# Altium schematic sheet IPM-DRIVER-1.SchDoc
size A4
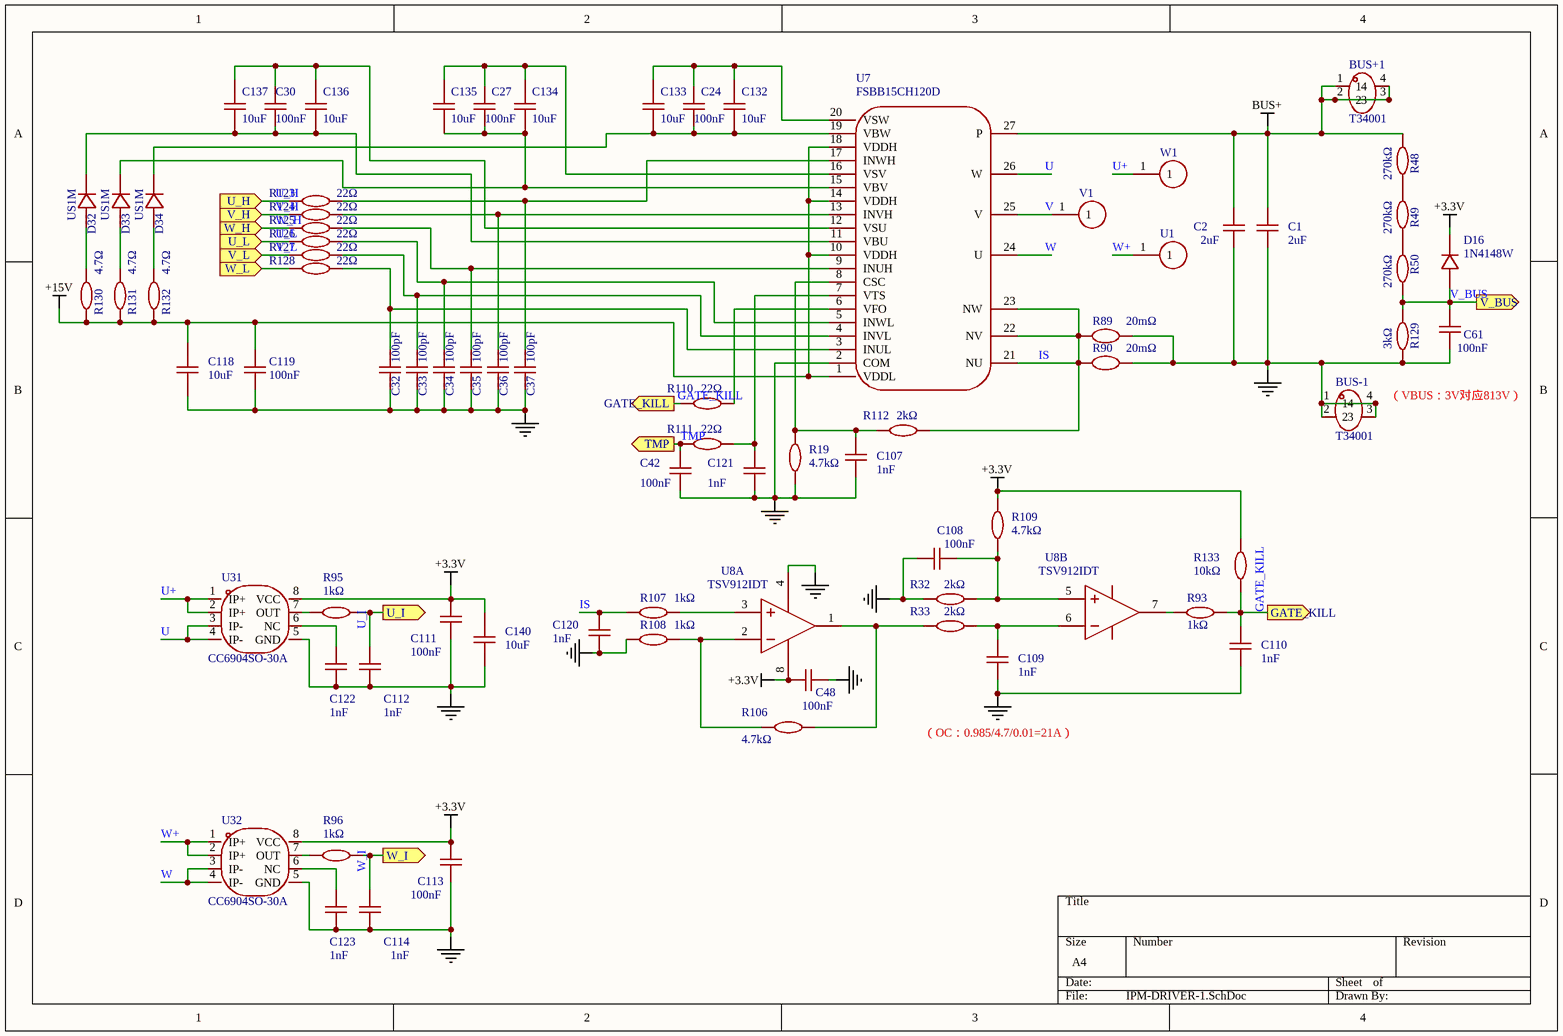
[diagram p0: IPM-DRIVER-1.SchDoc]

## Parts
BUS+1  T34001  [CONN-TH_T34001]
BUS-1  T34001  [CONN-TH_T34001]
C1  2uF  [CAP-TH_L32.0-W13.0-P27.50-D0.8]
C2  2uF  [CAP-TH_L32.0-W13.0-P27.50-D0.8]
C24  100nF  [C0603]
C27  100nF  [C0603]
C30  100nF  [C0603]
C32  100pF  [C0603]
C33  100pF  [C0603]
C34  100pF  [C0603]
C35  100pF  [C0603]
C36  100pF  [C0603]
C37  100pF  [C0603]
C42  100nF  [C0603]
C48  100nF  [C0603]
C61  100nF  [C0603]
C107  1nF  [C0603]
C108  100nF  [C0603]
C109  1nF  [C0603]
C110  1nF  [C0603]
C111  100nF  [C0603]
C112  1nF  [C0603]
C113  100nF  [C0603]
C114  1nF  [C0603]
C118  10uF  [C1206]
C119  100nF  [C0603]
C120  1nF  [C0603]
C121  1nF  [C0603]
C122  1nF  [C0603]
C123  1nF  [C0603]
C132  10uF  [C1206]
C133  10uF  [C1206]
C134  10uF  [C1206]
C135  10uF  [C1206]
C136  10uF  [C1206]
C137  10uF  [C1206]
C140  10uF  [C0805]
D16  1N4148W  [SOD-123_L2.8-W1.8-LS3.7-RD]
D32  US1M  [SMA_L4.4-W2.8-LS5.4-RD]
D33  US1M  [SMA_L4.4-W2.8-LS5.4-RD]
D34  US1M  [SMA_L4.4-W2.8-LS5.4-RD]
R19  4.7kΩ  [R0603]
R32  2kΩ  [R0603]
R33  2kΩ  [R0603]
R48  270kΩ  [R1206]
R49  270kΩ  [R1206]
R50  270kΩ  [R1206]
R89  20mΩ  [RES-SMD_L6.4-W3.2-1]
R90  20mΩ  [RES-SMD_L6.4-W3.2-1]
R93  1kΩ  [R0603]
R95  1kΩ  [R0603]
R96  1kΩ  [R0603]
R106  4.7kΩ  [R0603]
R107  1kΩ  [R0603]
R108  1kΩ  [R0603]
R109  4.7kΩ  [R0603]
R110  22Ω  [R0603]
R111  22Ω  [R0603]
R112  2kΩ  [R0603]
R123  22Ω  [R0603]
R124  22Ω  [R0603]
R125  22Ω  [R0603]
R126  22Ω  [R0603]
R127  22Ω  [R0603]
R128  22Ω  [R0603]
R129  3kΩ  [R1206]
R130  4.7Ω  [R0805]
R131  4.7Ω  [R0805]
R132  4.7Ω  [R0805]
R133  10kΩ  [R0603]
U1  (no value)  [HOLE-1.6]
U7  FSBB15CH120D  [SPM-27-RA]
U8  TSV912IDT  [SO-8_L4.9-W3.9-P1.27-LS6.0-BL]  (parts A,B of 2)
U31  CC6904SO-30A  [SOP-8_L4.9-W3.9-P1.27-LS6.0-BL]
U32  CC6904SO-30A  [SOP-8_L4.9-W3.9-P1.27-LS6.0-BL]
V1  (no value)  [HOLE-1.6]
W1  (no value)  [HOLE-1.6]

## Ports
GATE_KILL (out), TMP (out), U_H (in), U_I (out), U_L (in), V_BUS (out), V_H (in), V_L (in), W_H (in), W_I (out), W_L (in)

## Nets
+3.3V: C48.1 C111.1 C113.1 C140.2 D16.1(K) R109.2 R133.2 U8.8(VCC+) U31.8(VCC) U32.8(VCC)
+15V: C118.2 C119.1 R130.1 R131.1 R132.1 U7.1(VDDL) U7.10(VDDH) U7.14(VDDH) U7.18(VDDH)
BUS+: BUS+1.1 BUS+1.2 BUS+1.3 BUS+1.4 C1.2 C2.2 R48.2 U7.27(P)
GND: BUS-1.1 BUS-1.2 BUS-1.3 BUS-1.4 C1.1 C2.1 C32.1 C33.1 C34.1 C35.1 C36.1 C37.1 C42.2 C48.2 C61.2 C107.1 C108.1 C109.1 C110.1 C111.2 C112.1 C113.2 C114.1 C118.1 C119.2 C120.2 C121.1 C122.1 C123.1 C140.1 R19.1 R32.1 R89.2 R90.2 R108.2 R129.1 U7.2(COM) U8.4(VCC-) U31.5(GND) U32.5(GND)
GATE_KILL: C110.2 R93.1 R110.1 R133.1 ; port GATE_KILL
IS: C120.1 R89.1 R90.1 R107.2 R112.2 U7.21(NU) U7.22(NV) U7.23(NW)
TMP: C42.1 R111.1 ; port TMP
U: U7.26(W) U31.3(IP-) U31.4(IP-)
U+: U31.1(IP+) U31.2(IP+) W1.1
U_H: R123.1 ; port U_H
U_I: C112.2 R95.1 ; port U_I
U_L: R126.1 ; port U_L
V: U7.25(V) V1.1
V_BUS: C61.1 D16.2(A) R50.1 R129.2 ; port V_BUS
V_H: R124.1 ; port V_H
V_L: R127.1 ; port V_L
W: U7.24(U) U32.3(IP-) U32.4(IP-)
W+: U1.1 U32.1(IP+) U32.2(IP+)
W_H: R125.1 ; port W_H
W_I: C114.2 R96.1 ; port W_I
W_L: R128.1 ; port W_L
NetC24_1: C24.1 C132.2 C133.2 U7.20(VSW)
NetC24_2: C24.2 C132.1 C133.1 D34.1(C) U7.19(VBW)
NetC27_1: C27.1 C134.2 C135.2 U7.16(VSV)
NetC27_2: C27.2 C134.1 C135.1 D33.1(C) U7.15(VBV)
NetC30_1: C30.1 C136.2 C137.2 U7.12(VSU)
NetC30_2: C30.2 C136.1 C137.1 D32.1(C) U7.11(VBU)
NetC32_2: C32.2 R128.2 U7.3(INUL)
NetC33_2: C33.2 R127.2 U7.4(INVL)
NetC34_2: C34.2 R126.2 U7.5(INWL)
NetC35_2: C35.2 R125.2 U7.9(INUH)
NetC36_2: C36.2 R124.2 U7.13(INVH)
NetC37_2: C37.2 R123.2 U7.17(INWH)
NetC107_2: C107.2 R19.2 R112.1 U7.8(CSC)
NetC108_2: C108.2 R32.2 R109.1 U8.5(IN2+)
NetC109_2: C109.2 R33.2 U8.6(IN2-)
NetC121_2: C121.2 R111.2 U7.7(VTS)
NetC122_2: C122.2 U31.6(NC)
NetC123_2: C123.2 U32.6(NC)
NetD32_2: D32.2(A) R130.2
NetD33_2: D33.2(A) R131.2
NetD34_2: D34.2(A) R132.2
NetR33_1: R33.1 R106.2 U8.1(OUT1)
NetR48_1: R48.1 R49.2
NetR49_1: R49.1 R50.2
NetR93_2: R93.2 U8.7(OUT2)
NetR95_2: R95.2 U31.7(OUT)
NetR96_2: R96.2 U32.7(OUT)
NetR106_1: R106.1 R108.1 U8.2(IN1-)
NetR107_1: R107.1 U8.3(IN1+)
NetR110_2: R110.2 U7.6(VFO)

## Notes on the sheet
- （VBUS：3V对应813V）
- （OC：0.985/4.7/0.01=21A）

## Library data of the parts
BUS+1 BUS-1 = T34001: Manufacturer: XFCN(兴飞); Add into BOM: yes; Symbol: T34001; Device: T34001; Supplier: LCSC; Supplier Part: C481448; Manufacturer Part: T34001; JLCPCB Part Class: 扩展库; LCSC Part Name: 四脚 M3 二件套; Supplier Footprint: 插件; Datasheet: https://atta.szlcsc.com/upload/public/pdf/source/20200107/C481448_4214B4EB74A46B70BD82BA8A456D4EDD.pdf; Convert to PCB: yes; Comment_1: T34001
C1 C2 = C3D3A205KB00C00: 容值:2uF;精度:±10%;额定电压:1kV;工作温度:-40℃~+105℃;; Manufacturer: faratronic(厦门法拉); Manufacturer Part: C3D1M205KB00C00; Add into BOM: yes; Tolerance: ±10%; Voltage Rated: 1kV; Symbol: C3D3A205KB00C00; Device: C3D3A205KB00C00; Supplier: LCSC; Supplier Part: C2979669; Value: 2uF; JLCPCB Part Class: 扩展库; LCSC Part Name: 2uF ±10% 1kV; Supplier Footprint: 插件,P=27.5mm; Datasheet: https://atta.szlcsc.com/upload/public/pdf/source/20220311/E68D7E85A489AC17A4FEDF411604B395.pdf; Convert to PCB: yes; Operating Temperature: -40℃~+105℃; Comment_1: 2uF
C24 C27 C30 C42 C48 C61 C108 C111 C113 C119 = 0603B104K500NT: 容值:100nF;精度:±10%;额定电压:50V;材质(温度系数):X7R;; Manufacturer: FH(风华); Add into BOM: yes; Tolerance: ±10%; Voltage Rated: 50V; Temperature Coefficient: X7R; Symbol: 0603B104K500NT; Device: 0603B104K500NT; Supplier: LCSC; Manufacturer Part: 0603B104K500NT; Value: 100nF; Supplier Part: C30926; JLCPCB Part Class: 扩展库; LCSC Part Name: 100nF ±10% 50V; Supplier Footprint: 0603; Datasheet: https://atta.szlcsc.com/upload/public/pdf/source/20200305/C486355_26A10D38EF8C2A5C37091D0039909270.pdf; Convert to PCB: yes; Comment_1: 100nF
C32-C37 = CC0603KRX7R9BB101: 容值:100pF;精度:±10%;额定电压:50V;材质(温度系数):X7R;; Manufacturer: YAGEO(国巨); Add into BOM: yes; Tolerance: ±10%; Voltage Rated: 50V; Temperature Coefficient: X7R; Symbol: CC0603KRX7R9BB101; Device: CC0603KRX7R9BB101; Supplier: LCSC; Supplier Part: C160903; Manufacturer Part: CC0603KRX7R9BB101; Value: 100pF; JLCPCB Part Class: 扩展库; LCSC Part Name: 100pF ±10% 50V; Supplier Footprint: 0603; Datasheet: https://atta.szlcsc.com/upload/public/pdf/source/20180910/C282072_33301C7F631E79921B82A8DAC6BCC5B3.pdf; Convert to PCB: yes; Comment_1: 100pF
C107 C109 C110 C112 C114 C120-C123 = CC0603KRX7R9BB102: 容值:1nF;精度:±10%;额定电压:50V;材质(温度系数):X7R;; Manufacturer: YAGEO(国巨); Add into BOM: yes; Tolerance: ±10%; Voltage Rated: 50V; Temperature Coefficient: X7R; Symbol: CC0603KRX7R9BB102; Device: CC0603KRX7R9BB102; Supplier: LCSC; Manufacturer Part: CC0603KRX7R9BB102; Value: 1nF; Supplier Part: C100040; JLCPCB Part Class: 扩展库; LCSC Part Name: 1nF ±10% 50V; Supplier Footprint: 0603; Datasheet: https://atta.szlcsc.com/upload/public/pdf/source/20180910/C282072_33301C7F631E79921B82A8DAC6BCC5B3.pdf; Convert to PCB: yes; Comment_1: 1nF
C118 = 1206B106K500NT: 容值:10uF;精度:±10%;额定电压:50V;材质(温度系数):X7R;; Manufacturer: FH(风华); Add into BOM: yes; Tolerance: ±10%; Voltage Rated: 50V; Temperature Coefficient: X7R; Symbol: 1206B106K500NT; Device: 1206B106K500NT; Supplier: LCSC; Supplier Part: C303950; Manufacturer Part: 1206B106K500NT; Value: 10uF; JLCPCB Part Class: 扩展库; LCSC Part Name: 10uF ±10% 50V; Supplier Footprint: 1206; Datasheet: https://atta.szlcsc.com/upload/public/pdf/source/20200305/C486355_26A10D38EF8C2A5C37091D0039909270.pdf; Convert to PCB: yes; Comment_1: 10uF
C132-C137 = 1206B106K250NT: 容值:10uF;精度:±10%;额定电压:25V;材质(温度系数):X7R;; Manufacturer: FH(风华); Add into BOM: yes; Tolerance: ±10%; Voltage Rated: 25V; Temperature Coefficient: X7R; Symbol: 1206B106K250NT; Device: 1206B106K250NT; Supplier: LCSC; Manufacturer Part: 1206B106K250NT; Value: 10uF; Supplier Part: C90538; JLCPCB Part Class: 扩展库; LCSC Part Name: 10uF ±10% 25V; Supplier Footprint: 1206; Datasheet: https://atta.szlcsc.com/upload/public/pdf/source/20200305/C486355_26A10D38EF8C2A5C37091D0039909270.pdf; Convert to PCB: yes; Comment_1: 10uF
C140 = CL21B106KOQNNNE: 容值:10uF;精度:±10%;额定电压:16V;材质(温度系数):X7R;; Manufacturer: SAMSUNG(三星); Add into BOM: yes; Tolerance: ±10%; Voltage Rated: 16V; Temperature Coefficient: X7R; Symbol: CL21B106KOQNNNE; Device: CL21B106KOQNNNE; Supplier: LCSC; Manufacturer Part: CL21B106KOQNNNE; Value: 10uF; Supplier Part: C95841; JLCPCB Part Class: 扩展库; LCSC Part Name: 10uF ±10% 16V; Supplier Footprint: 0805; Datasheet: https://atta.szlcsc.com/upload/public/pdf/source/20160218/1457707763339.pdf; Convert to PCB: yes; Comment_1: 10uF
D16 = 1N4148W_C2099: 二极管配置:独立式;正向压降(Vf):1.25V@150mA;直流反向耐压(Vr):100V;平均整流电流(Io):150mA;功率:500mW;反向恢复时间(trr):4ns;; Manufacturer: CJ(江苏长电/长晶); Symbol: 1N4148W T4; Add into BOM: yes; Diode Configuration: 独立式; Reverse Voltage (Vr): 100V; Average Rectified Current (Io): 150mA; Power Dissipation: 500mW; Reverse Leakage Current: 1uA@75V; Reverse Recovery Time (trr): 4ns; Device: 1N4148W_C2099; Supplier: LCSC; Manufacturer Part: 1N4148W; Supplier Part: C2099; JLCPCB Part Class: 扩展库; LCSC Part Name: 电压:100V 电流:150mA; Supplier Footprint: SOD-123; Datasheet: https://atta.szlcsc.com/upload/public/pdf/source/20120428/1457706480199.pdf; Convert to PCB: yes; Forward Voltage (Vf@If): 1.25V@150mA; Operating Temperature: -; Comment_1: 1N4148W
D32-D34 = US1M_C412437: 二极管配置:独立式;正向压降(Vf):1.7V@1A;直流反向耐压(Vr):1kV;平均整流电流(Io):1A;反向恢复时间(trr):75ns;; Manufacturer: MDD; Symbol: US1MG_C412437; Add into BOM: yes; Diode Configuration: 独立式; Reverse Voltage (Vr): 1kV; Average Rectified Current (Io): 1A; Reverse Leakage Current: 5uA@1kV; Reverse Recovery Time (trr): 75ns; Device: US1M_C412437; Supplier: LCSC; Supplier Part: C412437; Manufacturer Part: US1M; JLCPCB Part Class: 基础库; LCSC Part Name: 电压:1kV 电流:1A; Supplier Footprint: SMA; Datasheet: https://atta.szlcsc.com/upload/public/pdf/source/20230314/F0756B025DF5B8F55B4CA0C779F501E8.pdf; Convert to PCB: yes; Forward Voltage (Vf@If): 1.7V@1A; Operating Temperature: -50℃~+150℃@(Tj); Comment_1: US1M
R19 R106 R109 = 0603WAF4701T5E: 电阻类型:厚膜电阻;阻值:4.7kΩ;精度:±1%;功率:100mW;最大工作电压:75V;温度系数:±100ppm/℃;; Manufacturer: UNI-ROYAL(厚声); Add into BOM: yes; Tolerance: ±1%; Power(Watts): 100mW; Overload Voltage (Max): 75V; Symbol: 0603WAF4701T5E; Device: 0603WAF4701T5E; Supplier: LCSC; Manufacturer Part: 0603WAF4701T5E; Supplier Part: C23162; Value: 4.7kΩ; JLCPCB Part Class: 基础库; LCSC Part Name: 4.7kΩ ±1% 100mW 厚膜电阻; Supplier Footprint: 0603; Datasheet: https://atta.szlcsc.com/upload/public/pdf/source/20200306/C422600_1E6D84923E4A46A82E41ADD87F860B5C.pdf; Convert to PCB: yes; Type: 厚膜电阻; Temperature Coefficient: ±100ppm/℃; Operating Temperature Range: -55℃~+155℃; Comment_1: 4.7kΩ
R32 R33 R112 = 0603WAF2001T5E: 电阻类型:厚膜电阻;阻值:2kΩ;精度:±1%;功率:100mW;最大工作电压:75V;温度系数:±100ppm/℃;; Manufacturer: UNI-ROYAL(厚声); Add into BOM: yes; Tolerance: ±1%; Power(Watts): 100mW; Overload Voltage (Max): 75V; Symbol: 0603WAF2001T5E; Device: 0603WAF2001T5E; Supplier: LCSC; Manufacturer Part: 0603WAF2001T5E; Supplier Part: C22975; Value: 2kΩ; JLCPCB Part Class: 基础库; LCSC Part Name: 2kΩ ±1% 100mW 厚膜电阻; Supplier Footprint: 0603; Datasheet: https://atta.szlcsc.com/upload/public/pdf/source/20200306/C422600_1E6D84923E4A46A82E41ADD87F860B5C.pdf; Convert to PCB: yes; Type: 厚膜电阻; Temperature Coefficient: ±100ppm/℃; Operating Temperature Range: -55℃~+155℃; Comment_1: 2kΩ
R48-R50 = RC1206FR-07270KL: 电阻类型:厚膜电阻;阻值:270kΩ;精度:±1%;功率:250mW;最大工作电压:200V;温度系数:±100ppm/℃;; Manufacturer: YAGEO(国巨); Add into BOM: yes; Tolerance: ±1%; Power(Watts): 250mW; Overload Voltage (Max): 200V; Symbol: RC1206FR-07270KL; Device: RC1206FR-07270KL; LCSC Part Name: 厚膜电阻 270kΩ ±1% 250mW; Supplier Part: C137342; Manufacturer Part: RC1206FR-07270KL; Supplier Footprint: 1206; JLCPCB Part Class: 扩展库; Datasheet: https://atta.szlcsc.com/upload/public/pdf/source/20180821/C275644_0D56F95EFF785E7D9A1FEF436B37DA78.pdf; Supplier: LCSC; Convert to PCB: yes; Type: 厚膜电阻; Value: 270kΩ; Temperature Coefficient: ±100ppm/℃; Operating Temperature Range: -55℃~+155℃; Comment_1: 270kΩ
R89 R90 = LR2512D-3W-20mR-1%: 电阻类型:采样电阻;阻值:20mΩ;精度:±1%;功率:3W;温度系数:25ppm/℃~+50ppm/℃;安装方式:贴片;; Manufacturer: Milliohm(毫欧); Add into BOM: yes; Tolerance: ±1%; Power(Watts): 3W; Mounting Sytle: 贴片; Symbol: LR2512D-3W-20MR-1%; Device: LR2512D-3W-20mR-1%; Supplier: LCSC; Supplier Part: C500741; Manufacturer Part: LR2512D-3W-20mR-1%; Value: 20mΩ; JLCPCB Part Class: 扩展库; LCSC Part Name: 20mΩ ±1% 3W; Supplier Footprint: 2512; Datasheet: https://atta.szlcsc.com/upload/public/pdf/source/20211008/27BCB003066C6550DC06C87D8395239C.pdf; Convert to PCB: yes; Type: 采样电阻; Temperature Coefficient: 25ppm/℃~+50ppm/℃; Comment_1: 20mΩ
R93 R95 R96 R107 R108 = 0603WAF1001T5E: 电阻类型:厚膜电阻;阻值:1kΩ;精度:±1%;功率:100mW;最大工作电压:75V;温度系数:±100ppm/℃;; Manufacturer: UNI-ROYAL(厚声); Add into BOM: yes; Tolerance: ±1%; Power(Watts): 100mW; Overload Voltage (Max): 75V; Symbol: 0603WAF1001T5E; Device: 0603WAF1001T5E; Supplier: LCSC; Manufacturer Part: 0603WAF1001T5E; Supplier Part: C21190; Value: 1kΩ; JLCPCB Part Class: 基础库; LCSC Part Name: 1kΩ ±1% 100mW 厚膜电阻; Supplier Footprint: 0603; Datasheet: https://atta.szlcsc.com/upload/public/pdf/source/20200306/C422600_1E6D84923E4A46A82E41ADD87F860B5C.pdf; Convert to PCB: yes; Type: 厚膜电阻; Temperature Coefficient: ±100ppm/℃; Operating Temperature Range: -55℃~+155℃; Comment_1: 1kΩ
R110 R111 R123-R128 = 0603WAF220JT5E: 电阻类型:厚膜电阻;阻值:22Ω;精度:±1%;功率:100mW;最大工作电压:75V;温度系数:±100ppm/℃;; Manufacturer: UNI-ROYAL(厚声); Add into BOM: yes; Tolerance: ±1%; Power(Watts): 100mW; Overload Voltage (Max): 75V; Symbol: 0603WAF220JT5E; Device: 0603WAF220JT5E; Supplier: LCSC; Manufacturer Part: 0603WAF220JT5E; Supplier Part: C23345; Value: 22Ω; JLCPCB Part Class: 基础库; LCSC Part Name: 22Ω ±1% 100mW 厚膜电阻; Supplier Footprint: 0603; Datasheet: https://atta.szlcsc.com/upload/public/pdf/source/20200306/C422600_1E6D84923E4A46A82E41ADD87F860B5C.pdf; Convert to PCB: yes; Type: 厚膜电阻; Temperature Coefficient: ±100ppm/℃; Operating Temperature Range: -55℃~+155℃; Comment_1: 22Ω
R129 = 1206W4F3001T5E: 电阻类型:厚膜电阻;阻值:3kΩ;精度:±1%;功率:250mW;最大工作电压:200V;温度系数:±100ppm/℃;; Manufacturer: UNI-ROYAL(厚声); Add into BOM: yes; Tolerance: ±1%; Power(Watts): 250mW; Overload Voltage (Max): 200V; Symbol: 1206W4F3001T5E; Device: 1206W4F3001T5E; Supplier: LCSC; Manufacturer Part: 1206W4F3001T5E; Supplier Part: C18012; Value: 3kΩ; JLCPCB Part Class: 扩展库; LCSC Part Name: 3kΩ ±1% 250mW 厚膜电阻; Supplier Footprint: 1206; Datasheet: https://atta.szlcsc.com/upload/public/pdf/source/20200306/C422600_1E6D84923E4A46A82E41ADD87F860B5C.pdf; Convert to PCB: yes; Type: 厚膜电阻; Temperature Coefficient: ±100ppm/℃; Operating Temperature Range: -55℃~+155℃; Comment_1: 3kΩ
R130-R132 = 0805W8F470KT5E: 电阻类型:厚膜电阻;阻值:4.7Ω;精度:±1%;功率:125mW;最大工作电压:150V;温度系数:±200ppm/℃;; Manufacturer: UNI-ROYAL(厚声); Add into BOM: yes; Tolerance: ±1%; Power(Watts): 125mW; Overload Voltage (Max): 150V; Symbol: 0805W8F470KT5E; Device: 0805W8F470KT5E; Supplier: LCSC; Manufacturer Part: 0805W8F470KT5E; Supplier Part: C17675; Value: 4.7Ω; JLCPCB Part Class: 基础库; LCSC Part Name: 4.7Ω ±1% 125mW 厚膜电阻; Supplier Footprint: 0805; Datasheet: https://atta.szlcsc.com/upload/public/pdf/source/20200306/C422600_1E6D84923E4A46A82E41ADD87F860B5C.pdf; Convert to PCB: yes; Type: 厚膜电阻; Temperature Coefficient: ±200ppm/℃; Operating Temperature Range: -55℃~+155℃; Comment_1: 4.7Ω
R133 = 0603WAF1002T5E: 电阻类型:厚膜电阻;阻值:10kΩ;精度:±1%;功率:100mW;最大工作电压:75V;温度系数:±100ppm/℃;; Manufacturer: UNI-ROYAL(厚声); Add into BOM: yes; Tolerance: ±1%; Power(Watts): 100mW; Overload Voltage (Max): 75V; Symbol: 0603WAF1002T5E; Device: 0603WAF1002T5E; Supplier: LCSC; Manufacturer Part: 0603WAF1002T5E; Supplier Part: C25804; Value: 10kΩ; JLCPCB Part Class: 基础库; LCSC Part Name: 厚膜电阻 10kΩ ±1% 100mW; Supplier Footprint: 0603; Datasheet: https://atta.szlcsc.com/upload/public/pdf/source/20200306/C422600_1E6D84923E4A46A82E41ADD87F860B5C.pdf; Convert to PCB: yes; Type: 厚膜电阻; Temperature Coefficient: ±100ppm/℃; Operating Temperature Range: -55℃~+155℃; Comment_1: 10kΩ
U1 V1 W1 = PAD-4.5MM: Add into BOM: yes; Symbol: PAD-4.5MM; Device: PAD-4.5MM; Convert to PCB: yes; Comment_1: PAD-4.5MM
U7 = FNB35060T: Add into BOM: yes; Symbol: FNB35060T; Device: FNB35060T; Convert to PCB: yes; Comment_1: FSBB15CH120D
U8 = TSV912IDT: 放大器数:双路;增益带宽积(GBP):8MHz;输入偏置电流(Ib):1pA;压摆率(SR):4.5V/us;带宽(-3db):-;轨到轨:-;; Manufacturer: ST(意法半导体); Add into BOM: yes; Number of Circuits: 双路; Gain Bandwidth Product(GBP): 8MHz; Current - Input Bias(Ib): 1pA; Output Current: 35mA; Supply Voltage: 2.5V~5.5V; Supply Current: 820uA; Symbol: TSV912IDT; Device: TSV912IDT; LCSC Part Name: TSV912IDT; Supplier Part: C1509138; Manufacturer Part: TSV912IDT; Supplier Footprint: SO-8; JLCPCB Part Class: 扩展库; Datasheet: https://atta.szlcsc.com/upload/public/pdf/source/20201015/C882654_F49EC15FD6A974BF40D8ED13350A683B.pdf; Supplier: LCSC; Convert to PCB: yes; Slew Rate(SR): 4.5V/us; -3db Bandwidth: -; Output Type: -; Rail to Rail: -; Operating Temperature: -40℃~+125℃; Comment_1: TSV912IDT
U31 U32 = CC6904SO-30A: 电流测量范围:-30A~30A;隔离耐压:2000Vac;灵敏度:44mV/A;; Manufacturer: CrossChip(成都芯进); Add into BOM: yes; Supply Voltage: 3.3V; Sensitivity: 44mV/A; Standby Current: 5mA; Symbol: CC6904SO-30A; Device: CC6904SO-30A; Supplier: LCSC; Supplier Part: C521203; Manufacturer Part: CC6904SO-30A; JLCPCB Part Class: 扩展库; LCSC Part Name: 电流传感器; Supplier Footprint: SOP-8; Datasheet: https://atta.szlcsc.com/upload/public/pdf/source/20210401/C469389_DE7B6CEC6D15D3BAE6DB905C88CAD675.pdf; Convert to PCB: yes; Current Range: -30A~30A; Isolated Voltage Withstand: 2000Vac; Operating Temperature: -40℃~+125℃; Comment_1: CC6904SO-30A